# Altium schematic sheet Buttons-LED-Sheet.SchDoc
size A4; SheetNumber: 10; SheetTotal: 10
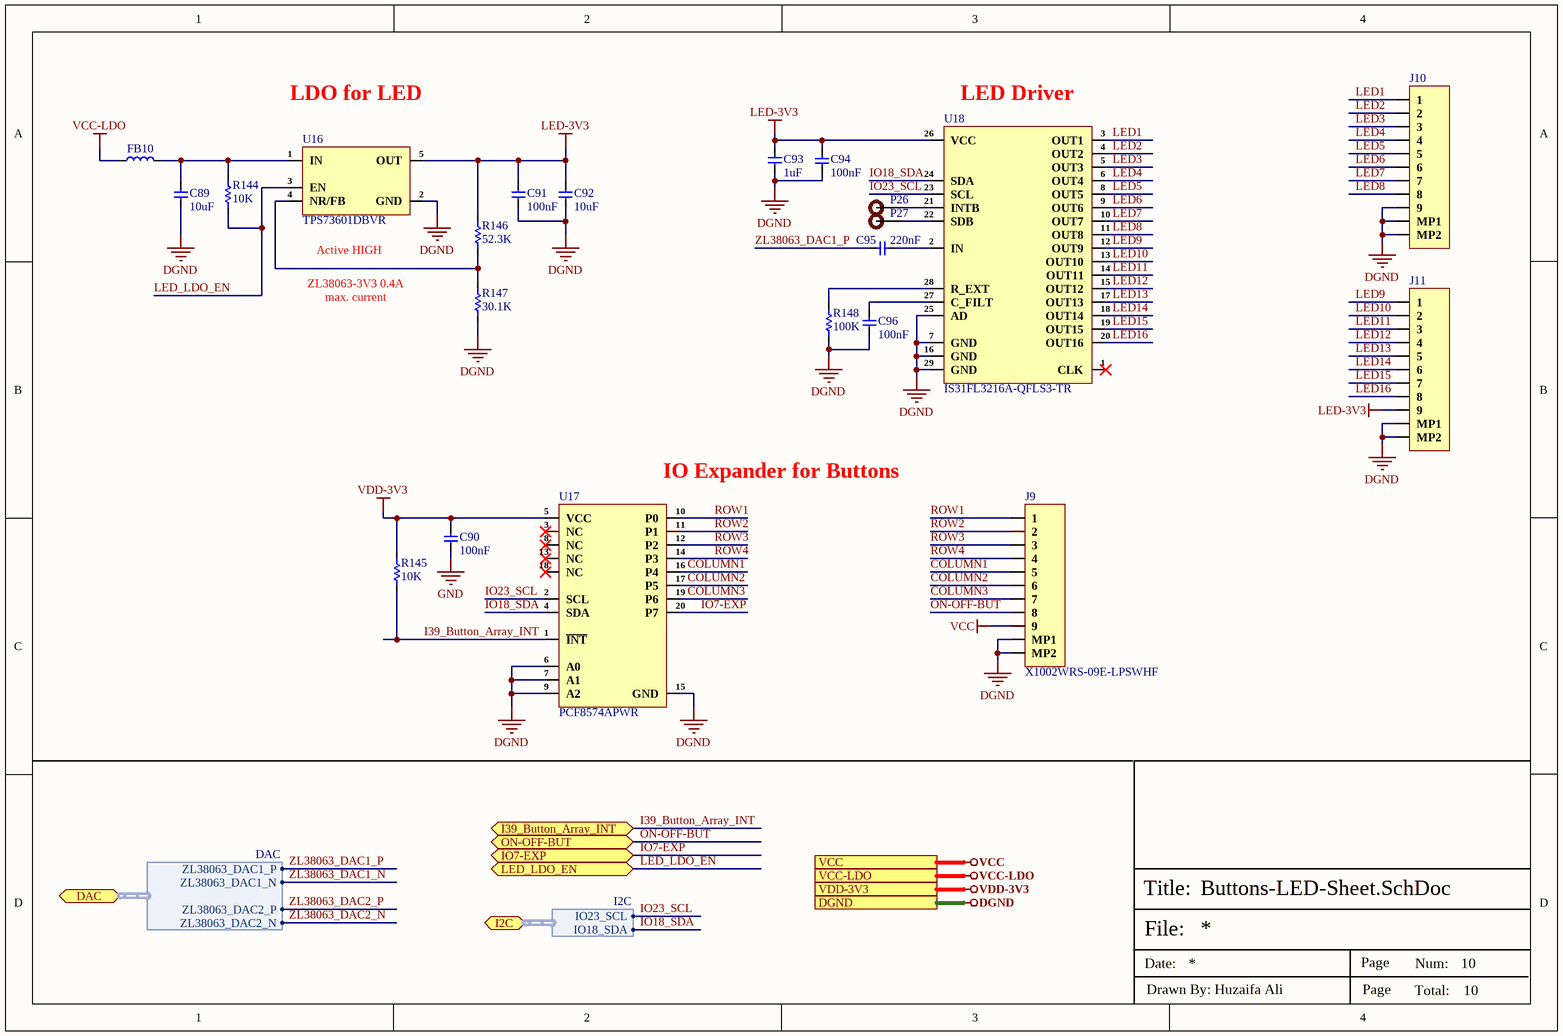
[diagram p0: Buttons-LED-Sheet.SchDoc]

## Parts
C89  10uF  [Cap-0603]
C90  100nF  [Cap-0402]
C91  100nF  [Cap-0402]
C92  10uF  [Cap-0603]
C93  1uF  [Cap-0402]
C94  100nF  [Cap-0402]
C95  220nF  [Cap-0402]
C96  100nF  [Cap-0402]
FB10  BLM18SG121TZ1D  [IND-0603 (1608 Metric)]  (value not drawn)
J9  X1002WRS-09E-LPSWHF  [X1002WRS-09E-LPSWHF]
J10  X1002WRS-09E-LPSWHF  [X1002WRS-09E-LPSWHF]  (value not drawn)
J11  X1002WRS-09E-LPSWHF  [X1002WRS-09E-LPSWHF]  (value not drawn)
P26  TEST POINT  [Test-point]  (value not drawn)
P27  TEST POINT  [Test-point]  (value not drawn)
R144  10K  [Res-0402]
R145  10K  [Res-0402]
R146  52.3K  [Res-0402]
R147  30.1K  [Res-0402]
R148  100K  [Res-0402]
U16  TPS73601DBVR  [SOT-23-5]
U17  PCF8574APWR  [TSSOP-20]
U18  IS31FL3216A-QFLS3-TR  [QFN-28-EP(4x4)]

## Ports
DAC (bidir, harness DAC, see Top-Sheet[3A]), DGND (see Top-Sheet[3A]), I2C (bidir, harness I2C, see Top-Sheet[3A]), I39_Button_Array_INT (bidir, see Top-Sheet[3A]), IO7-EXP (bidir, see Top-Sheet[3A]), LED_LDO_EN (bidir, see Top-Sheet[3B]), ON-OFF-BUT (bidir, see Top-Sheet[3A]), VCC (see Top-Sheet[3B]), VCC-LDO (see Top-Sheet[3A]), VDD-3V3 (see Top-Sheet[3A])

## Harnesses
I2C: IO23_SCL, IO18_SDA
DAC: ZL38063_DAC1_P, ZL38063_DAC1_N, ZL38063_DAC2_P, ZL38063_DAC2_N

## Nets
DGND: C89.1 C91.1 C92.1 C93.2 C94.1 C96.1 J9.MP1 J9.MP2 J10.9 J10.MP1 J10.MP2 J11.MP1 J11.MP2 R147.1 R148.1 U16.2(GND) U17.6(A0) U17.7(A1) U17.9(A2) U17.15(GND) U18.7(GND) U18.16(GND) U18.25(AD) U18.29(GND) ; port DGND
GND: C90.1
LED-3V3: C91.2 C92.2 C93.1 C94.2 J11.9 R146.2 U16.5(OUT) U18.26(VCC)
VCC: J9.9 ; port VCC
VCC-LDO: FB10.1 ; port VCC-LDO
VDD-3V3: C90.2 R145.2 U17.5(VCC) ; port VDD-3V3
COLUMN1: J9.5 U17.16(P4)
COLUMN2: J9.6 U17.17(P5)
COLUMN3: J9.7 U17.19(P6)
I39_Button_Array_INT: R145.1 U17.1(~{INT}) ; port I39_Button_Array_INT
IO7-EXP: U17.20(P7) ; port IO7-EXP
IO18_SDA: U17.4(SDA) U18.24(SDA) ; port I2C.IO18_SDA
IO23_SCL: U17.2(SCL) U18.23(SCL) ; port I2C.IO23_SCL
LED1: J10.1 U18.3(OUT1)
LED2: J10.2 U18.4(OUT2)
LED3: J10.3 U18.5(OUT3)
LED4: J10.4 U18.6(OUT4)
LED5: J10.5 U18.8(OUT5)
LED6: J10.6 U18.9(OUT6)
LED7: J10.7 U18.10(OUT7)
LED8: J10.8 U18.11(OUT8)
LED9: J11.1 U18.12(OUT9)
LED10: J11.2 U18.13(OUT10)
LED11: J11.3 U18.14(OUT11)
LED12: J11.4 U18.15(OUT12)
LED13: J11.5 U18.17(OUT13)
LED14: J11.6 U18.18(OUT14)
LED15: J11.7 U18.19(OUT15)
LED16: J11.8 U18.20(OUT16)
LED_LDO_EN: R144.1 U16.3(EN) ; port LED_LDO_EN
ON-OFF-BUT: J9.8 ; port ON-OFF-BUT
ROW1: J9.1 U17.10(P0)
ROW2: J9.2 U17.11(P1)
ROW3: J9.3 U17.12(P2)
ROW4: J9.4 U17.14(P3)
ZL38063_DAC1_N: port DAC.ZL38063_DAC1_N
ZL38063_DAC1_P: C95.1 ; port DAC.ZL38063_DAC1_P
ZL38063_DAC2_N: port DAC.ZL38063_DAC2_N
ZL38063_DAC2_P: port DAC.ZL38063_DAC2_P
NetC89_2: C89.2 FB10.2 R144.2 U16.1(IN)
NetC95_2: C95.2 U18.2(IN)
NetC96_2: C96.2 U18.27(C_FILT)
NetP26_1: P26.1 U18.21(INTB)
NetP27_1: P27.1 U18.22(SDB)
NetR146_1: R146.1 R147.2 U16.4(NR/FB)
NetR148_2: R148.2 U18.28(R_EXT)

Not connected (* = marked no-connect by the designer): U17 3(NC)* 8(NC)* 13(NC)* 18(NC)*; U18 1(CLK)*

## Notes on the sheet
- LDO for LED
- (near U18) LED Driver
- (near U16) Active HIGH
- ZL38063-3V3 0.4A max. current
- (near U17) IO Expander for Buttons
- File:
- Title:
- Date:
- Page
- Num:
- Total:
- Drawn By: Huzaifa Ali

## Library data of the parts
C89 C92 = CC0603KRX5R7BB106: CAP CER 10UF 16V X5R 0603; Manufacturer: Yageo; Tolerance: 10%; Item Type: Capacitor; Supplier 1: Digi-Key; Manufacturer Part Number: CC0603KRX5R7BB106; RoHS: Yes; Category: Ceramic Capacitors; Stock 1: 240725; Pricing 1: 1=0.68000, 10=0.48000, 50=0.36300, 100=0.31610, 500=0.23416, 1000=0.19903 (USD); Mount: Surface Mount; Case/Package: 0603; Case Code (Imperial): 0603; Case Code (Metric): 1608; Min Operating Temperature: -55°C; Max Operating Temperature: 85°C; Packaging: Cut Tape; Capacitance: 10uF; Voltage Rating: 16V; RoHS Compliant: Yes; ComponentLink1URL: http://www.yageo.com/documents/recent/UPY-GPHC_X5R_4V-to-50V_25.pdf?src-supplier=Digi-Key; ComponentLink1Description: http://www.yageo.com/documents/recent/UPY-GPHC_X5R_4V-to-50V_25.pdf?src-supplier=Digi-Key; Supplier Part Number 1: 311-3486-1-ND; LCSC Part Number: C2936601
C90 C91 C94 C96 = CC0402KRX5R7BB104: CAP CER 0.1UF 16V X5R 0402; Manufacturer: Yageo; Tolerance: 10%; Supplier 1: Mouser; Manufacturer Part Number: CC0402KRX5R7BB104; RoHS: Yes; Category: Ceramic Capacitors; Stock 1: 936792; Pricing 1: 1=0.10000, 10=0.02300, 50=0.02300, 100=0.01100, 1000=0.00600, 10000=0.00400 (USD); Mount: Surface Mount; Case/Package: 0402; Number of Pins: 2; Case Code (Metric): 1005; Case Code (Imperial): 0402; Min Operating Temperature: -55°C; Max Operating Temperature: 85°C; Capacitance: 100nF; Dielectric: X5R; Packaging: Tape and Reel; Voltage Rating: 16V; Package Quantity: 1; Voltage Rating (DC): 16V; Termination: SMD/SMT; Resistor Type: Ceramic; Series: CC; Construction: Flat; Length: 1mm; Width: 0.02inch; Height: 0.5mm; Thickness: 0.022inch; Depth: 0.5mm; Radiation Hardening: No; REACH SVHC: Unknown; Lead Free: Lead Free; Halogen Free: Halogen Free; RoHS Compliant: Yes; ComponentLink1URL: https://datasheet.ciiva.com/155/mlccorderingcode-155879.pdf?src-supplier=Digi-Key; ComponentLink1Description: https://datasheet.ciiva.com/155/mlccorderingcode-155879.pdf?src-supplier=Digi-Key; ComponentLink2URL: https://datasheet.ciiva.com/155/mlccorderingcode-155878.pdf?src-supplier=Digi-Key; ComponentLink2Description: https://datasheet.ciiva.com/155/mlccorderingcode-155878.pdf?src-supplier=Digi-Key; ComponentLink3URL: https://datasheet.ciiva.com/155/mlccorderingcode-155880.pdf?src-supplier=Digi-Key; ComponentLink3Description: https://datasheet.ciiva.com/155/mlccorderingcode-155880.pdf?src-supplier=Digi-Key; ComponentLink4URL: https://datasheet.ciiva.com/11464/upy-gphc-x5r-4v-to-50v-12-11464869.pdf?src-supplier=Avnet; ComponentLink4Description: https://datasheet.ciiva.com/11464/upy-gphc-x5r-4v-to-50v-12-11464869.pdf?src-supplier=Avnet; Supplier Part Number 1: 603-CC402KRX5R7BB104; LCSC Part Number: C106204
C93 = CC0402KRX5R8BB105: CAP CER 1UF 25V X5R 0402; Manufacturer: Yageo; Tolerance: 10%; Supplier 1: Mouser; Manufacturer Part Number: CC0402KRX5R8BB105; RoHS: Yes; Category: Ceramic Capacitors; Stock 1: 91975; Pricing 1: 1=0.30000, 10=0.20400, 50=0.20400, 100=0.11600, 1000=0.07200, 10000=0.05900 (USD); Mount: Surface Mount; Case/Package: 0402; Case Code (Metric): 1005; Case Code (Imperial): 0402; Weight: 2.3E-05oz; Min Operating Temperature: -55°C; Max Operating Temperature: 85°C; Packaging: Tape and Reel; Capacitance: 1uF; Voltage Rating: 25V; Dielectric: X5R; Termination: SMD/SMT; Voltage Rating (DC): 25V; Package Quantity: 10000; Length: 0.039inch; Width: 0.02inch; Thickness: 0.022inch; Lead Free: Lead Free; Halogen Free: Halogen Free; RoHS Compliant: Yes; ComponentLink1URL: http://www.mouser.com/ds/2/447/Yageo_UPY-GP_NP0_16V-to-50V_9-358835.pdf?src-supplier=Mouser; ComponentLink1Description: http://www.mouser.com/ds/2/447/Yageo_UPY-GP_NP0_16V-to-50V_9-358835.pdf?src-supplier=Mouser; ComponentLink2URL: http://www.yageo.com/documents/recent/UPY-GPHC_X5R_4V-to-50V_25.pdf?src-supplier=Digi-Key; ComponentLink2Description: http://www.yageo.com/documents/recent/UPY-GPHC_X5R_4V-to-50V_25.pdf?src-supplier=Digi-Key; ComponentLink3URL: https://4donline.ihs.com/images/VipMasterIC/IC/YAGO/YAGO-S-A0006851646/YAGO-S-A0006851646-1.pdf?hkey=6D3A4C79FDBF58556ACFDE234799DDF0&src-supplier=Newark; ComponentLink3Description: https://4donline.ihs.com/images/VipMasterIC/IC/YAGO/YAGO-S-A0006851646/YAGO-S-A0006851646-1.pdf?hkey=6D3A4C79FDBF58556ACFDE234799DDF0&src-supplier=Newark; Supplier Part Number 1: 603-CC402KRX5R8BB105; LCSC Part Number: C326568
C95 = CC0402KRX5R8BB224: CAP CER 0.22UF 25V X5R 0402; Manufacturer: Yageo; Tolerance: 10%; Supplier 1: Mouser; Manufacturer Part Number: CC0402KRX5R8BB224; RoHS: Yes; Category: Ceramic Capacitors; Stock 1: 61266; Pricing 1: 1=0.10000, 10=0.03300, 50=0.03300, 100=0.02700, 1000=0.01500, 10000=0.01300 (USD); Mount: Surface Mount; Case/Package: 0402; Min Operating Temperature: -55°C; Max Operating Temperature: 85°C; Packaging: Tape and Reel; Capacitance: 220nF; Voltage Rating: 25V; Voltage Rating (DC): 25V; Dielectric: X5R; Length: 0.039inch; Width: 0.02inch; Thickness: 0.022inch; Lead Free: Lead Free; Halogen Free: Halogen Free; RoHS Compliant: Yes; ComponentLink1URL: http://www.yageo.com/documents/recent/UPY-GPHC_X5R_4V-to-50V_25.pdf?src-supplier=Digi-Key; ComponentLink1Description: http://www.yageo.com/documents/recent/UPY-GPHC_X5R_4V-to-50V_25.pdf?src-supplier=Digi-Key; ComponentLink2URL: https://www.yageo.com/upload/media/product/productsearch/datasheet/mlcc/UPY-GPHC_X5R_4V-to-50V_26.pdf?src-supplier=Digi-Key; ComponentLink2Description: https://www.yageo.com/upload/media/product/productsearch/datasheet/mlcc/UPY-GPHC_X5R_4V-to-50V_26.pdf?src-supplier=Digi-Key; ComponentLink3URL: http://www.yageo.com/documents/recent/UPY-GPHC_X5R_4V-to-50V_23.pdf?src-supplier=Digi-Key; ComponentLink3Description: http://www.yageo.com/documents/recent/UPY-GPHC_X5R_4V-to-50V_23.pdf?src-supplier=Digi-Key; Supplier Part Number 1: 603-CC402KRX5R8BB224; LCSC Part Number: C326836
FB10 = BLM18SG121TZ1D: FERRITE BEAD 120 OHM 0603 1LN; Manufacturer: Murata; Core Material: 228ConductorMaterial; Value: 25mR; RMS Current (Irms): 3A; Test Frequency: 100MHz; Tolerance: 25%; Supplier: Rs; Supplier Part Number: 2234927P; Manufacturer Part Number: BLM18SG121TZ1D; RoHS: Yes; Category: Ferrite Beads and Chips; Stock: 19700; Pricing: 500=0.033, 1000=0.028, 2000=0.026, 5000=0.024 (GBP); ESR: 25mR; Height: 650um; ComponentLink1URL: https://datasheet.octopart.com/BLM18SG121TZ1D-Murata-datasheet-101965366.pdf?src-supplier=Future+Electronics; ComponentLink1Description: https://datasheet.octopart.com/BLM18SG121TZ1D-Murata-datasheet-101965366.pdf?src-supplier=Future+Electronics; ComponentLink2URL: https://www.murata.com/en-us/products/productdata/8796750610462/QNFA9122.pdf?src-supplier=Digi-Key; ComponentLink2Description: https://www.murata.com/en-us/products/productdata/8796750610462/QNFA9122.pdf?src-supplier=Digi-Key; LCSC Part Number: C710390; Item Type: Ferrite Bead
J9-J11 = X1002WRS-09E-LPSWHF: 1x9P 1 Tin 1mm male 9 260℃ -25℃~+85℃ Brass 1A Surface Mount SMD,P=1mm Wire To Board / Wire To Wire Connector ROHS; Manufacturer: XKB Connectivity; Manufacturer Part Number: X1002WRS-09E-LPSWHF; Package: SMD,P=1mm; LCSC Part Number: C437069; Item Type: Board / Wire To Wire Connector; ComponentLink1Description: LCSC; ComponentLink1URL: https://www.lcsc.com/product-detail/Wire-To-Board-Wire-To-Wire-Connector_XKB-Connectivity-X1002WRS-09E-LPSWHF_C437069.html
P26 P27 = TEST POINT: Test Point ON; Item Type: TEST POINT
R144 R145 = RC0402FR-0710KL: RES 10K OHM 1% 1/16W 0402; Manufacturer: Yageo; Resistance: 10kR; Voltage Rating (DC): 50V; Temperature Coefficient: 100ppm/°C; Power Rating: 62.5mW; Max Power Dissipation: 63mW; Item Type: Resistor; Supplier 1: Mouser; Manufacturer Part Number: RC0402FR-0710KL; RoHS: Yes; Category: Chip SMD Resistors; Stock 1: 18648329; Pricing 1: 1=0.10000, 10=0.01400, 50=0.01400, 100=0.00500, 1000=0.00300, 10000=0.00200 (USD); Case/Package: 0402; Number of Pins: 2; Case Code (Imperial): 0402; Case Code (Metric): 1005; Min Operating Temperature: -55°C; Max Operating Temperature: 155°C; Resistor Type: Thick Film; Tolerance: 1%; Packaging: Tape and Reel; Voltage Rating: 50V; Termination: SMD/SMT; Working Voltage: 50V; Number of Terminations: 2; Features: Moisture Resistant; Series: RC; Resistance Tolerance: 1%; Construction: Rectangular; Length: 1mm; Width: 0.5mm; Height: 0.32mm; Depth: 0.5mm; Lead Pitch: 0.2mm; REACH SVHC: No SVHC; Lead Free: Lead Free; RoHS Compliant: Yes; Military Standard: Not; ComponentLink1URL: https://datasheet.ciiva.com/7660/38568-7660787.pdf?src-supplier=Element14; ComponentLink1Description: https://datasheet.ciiva.com/7660/38568-7660787.pdf?src-supplier=Element14; ComponentLink2URL: https://datasheet.ciiva.com/7849/1686128-7849814.pdf?src-supplier=Element14; ComponentLink2Description: https://datasheet.ciiva.com/7849/1686128-7849814.pdf?src-supplier=Element14; ComponentLink3URL: https://datasheet.ciiva.com/7983/1018594-7983486.pdf?src-supplier=Element14; ComponentLink3Description: https://datasheet.ciiva.com/7983/1018594-7983486.pdf?src-supplier=Element14; ComponentLink4URL: https://datasheet.ciiva.com/22747/1018594-22747512.pdf?src-supplier=Element14; ComponentLink4Description: https://datasheet.ciiva.com/22747/1018594-22747512.pdf?src-supplier=Element14; ComponentLink5URL: https://datasheet.ciiva.com/12667/pyu-rc0402-51-rohs-l-6-r-12667067.pdf?src-supplier=Mouser; ComponentLink5Description: https://datasheet.ciiva.com/12667/pyu-rc0402-51-rohs-l-6-r-12667067.pdf?src-supplier=Mouser; ComponentLink6URL: https://datasheet.ciiva.com/7849/1784430-7849813.pdf?src-supplier=Element14; ComponentLink6Description: https://datasheet.ciiva.com/7849/1784430-7849813.pdf?src-supplier=Element14; ComponentLink7URL: https://datasheet.ciiva.com/7849/1784430-7849815.pdf?src-supplier=Element14; ComponentLink7Description: https://datasheet.ciiva.com/7849/1784430-7849815.pdf?src-supplier=Element14; Supplier Part Number 1: 603-RC0402FR-0710KL; LCSC Part Number: C60490
R146 = RT0402BRD0752K3L: RES SMD 52.3KOHM 0.1% 1/16W 0402; Manufacturer: Yageo; Item Type: Resistor; Supplier: Future Electronics; Supplier Part Number: 8123886; Manufacturer Part Number: RT0402BRD0752K3L; RoHS: Yes; Category: Chip SMD Resistors; Stock: 30000; Pricing: 10000=0.0218, 20000=0.0213, 30000=0.021, 50000=0.0206, 100000=0.0199 (USD); ComponentLink1URL: https://datasheet.ciiva.com/2582/pyu-rt-1-to-0-05-rohs-l-4-2582419.pdf?src-supplier=Digi-Key; ComponentLink1Description: https://datasheet.ciiva.com/2582/pyu-rt-1-to-0-05-rohs-l-4-2582419.pdf?src-supplier=Digi-Key; ComponentLink2URL: https://datasheet.ciiva.com/12798/pyu-rt-1-to-0-05-rohs-l-4-12798955.pdf?src-supplier=Mouser; ComponentLink2Description: https://datasheet.ciiva.com/12798/pyu-rt-1-to-0-05-rohs-l-4-12798955.pdf?src-supplier=Mouser; LCSC Part Number: C852832
R147 = RT0402BRD0730K1L: RES SMD 30.1KOHM 0.1% 1/16W 0402; Manufacturer: Yageo; Item Type: Resistor; Supplier: Rs; Supplier Part Number: 1991324P; Manufacturer Part Number: RT0402BRD0730K1L; RoHS: Yes; Category: Chip SMD Resistors; Stock: 7420; Pricing: 100=0.138, 250=0.115, 500=0.092, 1000=0.076 (GBP); ComponentLink1URL: https://datasheet.ciiva.com/12722/pyu-rt-1-to-0-05-rohs-l-4-12722119.pdf?src-supplier=Mouser; ComponentLink1Description: https://datasheet.ciiva.com/12722/pyu-rt-1-to-0-05-rohs-l-4-12722119.pdf?src-supplier=Mouser; ComponentLink2URL: https://datasheet.ciiva.com/2582/pyu-rt-1-to-0-05-rohs-l-5-2582303.pdf?src-supplier=Digi-Key; ComponentLink2Description: https://datasheet.ciiva.com/2582/pyu-rt-1-to-0-05-rohs-l-5-2582303.pdf?src-supplier=Digi-Key; LCSC Part Number: C852714
R148 = RC0402FR-07100KL: RES 100K OHM 1% 1/16W 0402; Manufacturer: Yageo; Resistance: 100kR; Temperature Coefficient: 100ppm/°C; Power Rating: 63mW; Voltage Rating: 50V; Item Type: Resistor; Supplier 1: Mouser; Manufacturer Part Number: RC0402FR-07100KL; RoHS: Yes; Category: Chip SMD Resistors; Stock 1: 7759549; Pricing 1: 1=0.10000, 10=0.01200, 50=0.01200, 100=0.00500, 1000=0.00300, 2500=0.00200, 10000=0.00100 (USD); Case/Package: 0402; Case Code (Metric): 1005; Case Code (Imperial): 0402; Min Operating Temperature: -55°C; Max Operating Temperature: 155°C; Resistor Type: Thick Film; Tolerance: 1%; Packaging: Tape and Reel; Package Quantity: 1; Number of Terminations: 2; Termination: SMD/SMT; Max Power Dissipation: 63mW; Working Voltage: 50V; Features: Moisture Resistant; Series: RC; Resistance Tolerance: 1%; Construction: Rectangular; Technology: THICK FILM; Length: 0.039inch; Width: 0.02inch; Height: 0.016inch; Depth: 0.5mm; REACH SVHC: No SVHC; Lead Free: Lead Free; RoHS Compliant: Yes; Military Standard: Not; ComponentLink1URL: https://datasheet.ciiva.com/11819/0900766b80c66297-11819452.pdf?src-supplier=RSComponents; ComponentLink1Description: https://datasheet.ciiva.com/11819/0900766b80c66297-11819452.pdf?src-supplier=RSComponents; ComponentLink2URL: https://datasheet.ciiva.com/22747/1018594-22747509.pdf?src-supplier=Element14; ComponentLink2Description: https://datasheet.ciiva.com/22747/1018594-22747509.pdf?src-supplier=Element14; ComponentLink3URL: https://datasheet.ciiva.com/2453/pyu-r-int-thick-7-2453362.pdf?src-supplier=Digi-Key; ComponentLink3Description: https://datasheet.ciiva.com/2453/pyu-r-int-thick-7-2453362.pdf?src-supplier=Digi-Key; ComponentLink4URL: https://datasheet.ciiva.com/2453/pyu-r-int-thick-7-2453363.pdf?src-supplier=Digi-Key; ComponentLink4Description: https://datasheet.ciiva.com/2453/pyu-r-int-thick-7-2453363.pdf?src-supplier=Digi-Key; ComponentLink5URL: https://datasheet.ciiva.com/2453/pyu-r-int-thick-7-2453361.pdf?src-supplier=Digi-Key; ComponentLink5Description: https://datasheet.ciiva.com/2453/pyu-r-int-thick-7-2453361.pdf?src-supplier=Digi-Key; ComponentLink6URL: https://datasheet.ciiva.com/12667/pyu-rc0402-51-rohs-l-6-r-12667930.pdf?src-supplier=Mouser; ComponentLink6Description: https://datasheet.ciiva.com/12667/pyu-rc0402-51-rohs-l-6-r-12667930.pdf?src-supplier=Mouser; ComponentLink7URL: https://datasheet.ciiva.com/15189/getdatasheetpartid-323696-15189334.pdf?src-supplier=Verical; ComponentLink7Description: https://datasheet.ciiva.com/15189/getdatasheetpartid-323696-15189334.pdf?src-supplier=Verical; Supplier Part Number 1: 603-RC0402FR-07100KL; LCSC Part Number: C60491
U16 = TPS73601DBVR: IC REG LIN POS ADJ 400MA SOT23-5; Manufacturer: Texas Instruments; Supplier: Mouser; Supplier Part Number: 595-TPS73601DBVR; Manufacturer Part Number: TPS73601DBVR; RoHS: Yes; Category: Voltage Regulators - Linear; Stock: 2988; Pricing: 1=1.44, 10=1.25, 50=1.25, 100=0.966, 1000=0.655, 10000=0.621 (USD); ComponentLink1URL: https://datasheet.ciiva.com/22700/1831172-22700145.pdf?src-supplier=Element14; ComponentLink1Description: https://datasheet.ciiva.com/22700/1831172-22700145.pdf?src-supplier=Element14; ComponentLink2URL: https://datasheet.ciiva.com/41462/001015018-da-01-en-ic-reg-ldo-adj-0-tps73601dbvr-sot-5-tid-41462863.pdf?src-supplier=Conrad; ComponentLink2Description: https://datasheet.ciiva.com/41462/001015018-da-01-en-ic-reg-ldo-adj-0-tps73601dbvr-sot-5-tid-41462863.pdf?src-supplier=Conrad; LCSC Part Number: C59200; Item Type: IC
U17 = PCF8574APWR: IC XPNDR 100KHZ I2C 20TSSOP; Manufacturer: Texas Instruments; Supplier: Mouser; Supplier Part Number: 595-PCF8574APWR; Manufacturer Part Number: PCF8574APWR; RoHS: Yes; Category: Interface ICs; Stock: 4215; Pricing: 1=1.54, 10=1.38, 50=1.38, 100=1.07, 1000=0.78, 10000=0.707 (USD); Length: 6.5mm; Width: 4.4mm; Thickness: 1mm; ComponentLink1URL: https://datasheet.ciiva.com/23785/1534147-23785504.pdf?src-supplier=Newark; ComponentLink1Description: https://datasheet.ciiva.com/23785/1534147-23785504.pdf?src-supplier=Newark; ComponentLink2URL: https://datasheet.ciiva.com/15134/getdatasheetpartid-253002-15134574.pdf?src-supplier=Verical; ComponentLink2Description: https://datasheet.ciiva.com/15134/getdatasheetpartid-253002-15134574.pdf?src-supplier=Verical; ComponentLink3URL: https://datasheet.ciiva.com/3149/pcf8574a-3149721.pdf?src-supplier=Avnet; ComponentLink3Description: https://datasheet.ciiva.com/3149/pcf8574a-3149721.pdf?src-supplier=Avnet; ComponentLink4URL: https://datasheet.ciiva.com/3149/pcf8574a-3149799.pdf?src-supplier=Avnet; ComponentLink4Description: https://datasheet.ciiva.com/3149/pcf8574a-3149799.pdf?src-supplier=Avnet; ComponentLink5URL: https://datasheet.ciiva.com/7747/1768199-7747660.pdf?src-supplier=Element14; ComponentLink5Description: https://datasheet.ciiva.com/7747/1768199-7747660.pdf?src-supplier=Element14; ComponentLink6URL: https://datasheet.ciiva.com/1780/pcf8574a-1780187.pdf?src-supplier=Digi-Key; ComponentLink6Description: https://datasheet.ciiva.com/1780/pcf8574a-1780187.pdf?src-supplier=Digi-Key; ComponentLink7URL: https://datasheet.ciiva.com/1780/pcf8574a-1780188.pdf?src-supplier=Digi-Key; ComponentLink7Description: https://datasheet.ciiva.com/1780/pcf8574a-1780188.pdf?src-supplier=Digi-Key; ComponentLink8URL: https://datasheet.ciiva.com/1780/pcf8574a-1780189.pdf?src-supplier=Digi-Key; ComponentLink8Description: https://datasheet.ciiva.com/1780/pcf8574a-1780189.pdf?src-supplier=Digi-Key; LCSC Part Number: C94361; Item Type: IC
U18 = IS31FL3216A-QFLS3-TR: IC LED DRVR LIN PWM 20MA 28QFN; Manufacturer: ISSI; Number of Outputs: 16; Max Supply Voltage: 5.5V; Supplier: Digi-Key; Supplier Part Number: 2521-IS31FL3216A-QFLS3-TRCT-ND; Manufacturer Part Number: IS31FL3216A-QFLS3-TR; RoHS: Yes; Category: LED Drivers; Stock: 11431; Pricing: 1=1.5, 10=1.341, 25=1.2728, 100=1.0454, 250=0.97716, 500=0.86356, 1000=0.68175 (USD); Mounting Technology: Surface Mount; Case/Package: QFN; Min Operating Temperature: -40°C; Max Operating Temperature: 105°C; Dimming: PWM; Packaging: Cut Tape; Output Current per Channel: 20mA; Series: -; RoHS Compliant: Yes; ComponentLink1URL: http://www.issi.com/WW/pdf/IS31FL3216A.pdf?src-supplier=Digi-Key; ComponentLink1Description: http://www.issi.com/WW/pdf/IS31FL3216A.pdf?src-supplier=Digi-Key; LCSC Part Number: C2678726; Item Type: IC